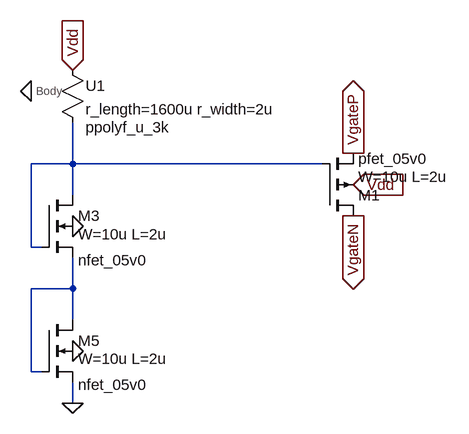
[diagram p0: schematic Startup.asc]
Startup.asc, the LTspice schematic file:
Version 4.1
SHEET 1 880 680
WIRE -464 -64 -464 -128
WIRE -464 -64 -528 -64
WIRE -80 -64 -464 -64
WIRE -464 -16 -464 -64
WIRE -528 64 -528 -64
WIRE -512 64 -528 64
WIRE -464 128 -464 80
WIRE -464 128 -528 128
WIRE -464 176 -464 128
WIRE -528 256 -528 128
WIRE -512 256 -528 256
WIRE -464 304 -464 272
FLAG -464 -208 Vdd
IOPIN -464 -208 In
FLAG -464 32 0
FLAG -528 -176 0
FLAG -32 -80 VgateP
IOPIN -32 -80 Out
FLAG -32 16 VgateN
IOPIN -32 16 Out
FLAG -464 304 0
FLAG -464 224 0
FLAG -32 -32 Vdd
IOPIN -32 -32 In
SYMBOL pmos4 -80 16 M180
WINDOW 3 56 60 Left 2
WINDOW 38 56 88 Left 2
SYMATTR Value W=10u L=2u
SYMATTR SpiceModel pfet_05v0
SYMATTR InstName M1
SYMATTR Prefix X
SYMBOL nmos4 -512 -16 R0
WINDOW 3 56 60 Left 2
WINDOW 38 56 100 Left 2
SYMATTR Value W=10u L=2u
SYMATTR SpiceModel nfet_05v0
SYMATTR InstName M3
SYMATTR Prefix X
SYMBOL res3 -480 -224 R0
WINDOW 38 36 104 Left 2
SYMATTR SpiceModel ppolyf_u_3k
SYMATTR InstName U1
SYMATTR Value r_length=1600u r_width=2u
SYMBOL nmos4 -512 176 R0
WINDOW 3 56 60 Left 2
WINDOW 38 56 100 Left 2
SYMATTR Value W=10u L=2u
SYMATTR SpiceModel nfet_05v0
SYMATTR InstName M5
SYMATTR Prefix X

The netlist it stands for:
* Startup.asc
X§M1 VgateN N001 VgateP Vdd pfet_05v0 W=10u L=2u  ; pins D G S B
X§M3 N001 N001 N002 0 nfet_05v0 W=10u L=2u  ; pins D G S B
X§U1 Vdd N001 0 ppolyf_u_3k r_length=1600u r_width=2u  ; pins A B Body
X§M5 N002 N002 0 0 nfet_05v0 W=10u L=2u  ; pins D G S B
.backanno
.end